# Altium schematic sheet Top_Sheet.SchDoc
size A; DocumentNumber: 1; SheetNumber: 1; SheetTotal: 13
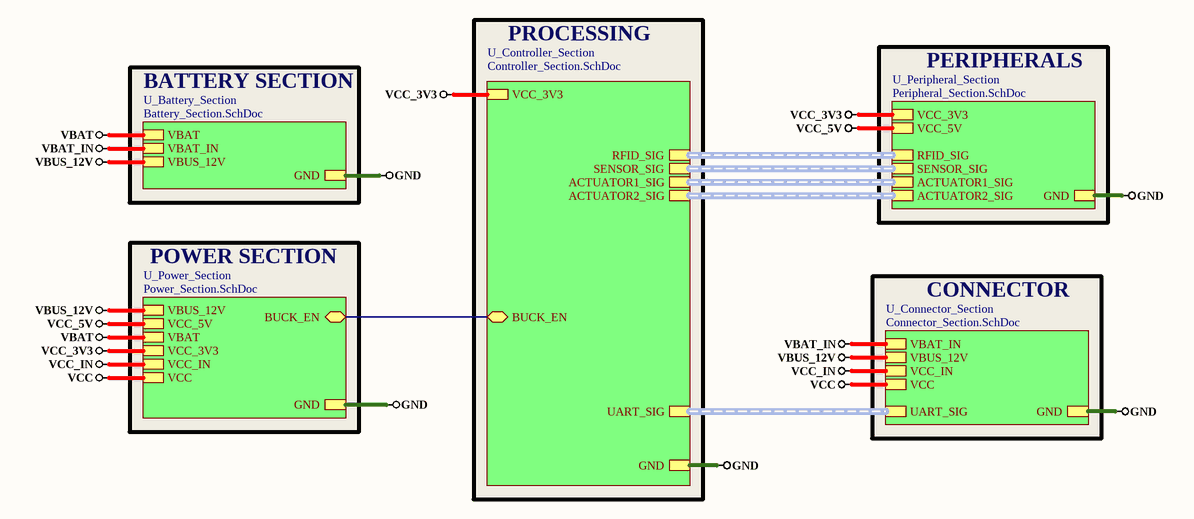
[diagram p0: Top_Sheet.SchDoc]

## Sub-sheets
U_Battery_Section = Battery_Section.SchDoc: VBAT, VBAT_IN, GND, VBUS_12V
U_Connector_Section = Connector_Section.SchDoc: GND, UART_SIG (harness UART_SIG), VBAT_IN, VBUS_12V, VCC_IN, VCC
U_Controller_Section = Controller_Section.SchDoc: ACTUATOR1_SIG (harness ACTUATOR1_SIG), ACTUATOR2_SIG (harness ACTUATOR2_SIG), GND, VCC_3V3, UART_SIG (harness UART_SIG), SENSOR_SIG (harness SENSOR_SIG), RFID_SIG (harness RFID_SIG), BUCK_EN (bidir)
U_Peripheral_Section = Peripheral_Section.SchDoc: GND, RFID_SIG (harness RFID_SIG), SENSOR_SIG (harness SENSOR_SIG), ACTUATOR2_SIG (harness ACTUATOR2_SIG), VCC_3V3, VCC_5V, ACTUATOR1_SIG (harness ACTUATOR1_SIG)
U_Power_Section = Power_Section.SchDoc: GND, VBUS_12V, VCC_5V, VBAT, VCC_3V3, VCC_IN, VCC, BUCK_EN (bidir)

## Nets
GND: sheet U_Controller_Section/GND, sheet U_Connector_Section/GND, sheet U_Battery_Section/GND, sheet U_Peripheral_Section/GND, sheet U_Power_Section/GND
VBAT: sheet U_Battery_Section/VBAT, sheet U_Power_Section/VBAT
VBAT_IN: sheet U_Connector_Section/VBAT_IN, sheet U_Battery_Section/VBAT_IN
VBUS_12V: sheet U_Connector_Section/VBUS_12V, sheet U_Battery_Section/VBUS_12V, sheet U_Power_Section/VBUS_12V
VCC: sheet U_Connector_Section/VCC, sheet U_Power_Section/VCC
VCC_3V3: sheet U_Controller_Section/VCC_3V3, sheet U_Peripheral_Section/VCC_3V3, sheet U_Power_Section/VCC_3V3
VCC_5V: sheet U_Peripheral_Section/VCC_5V, sheet U_Power_Section/VCC_5V
VCC_IN: sheet U_Connector_Section/VCC_IN, sheet U_Power_Section/VCC_IN
(unnamed): sheet U_Controller_Section/BUCK_EN, sheet U_Power_Section/BUCK_EN

## Buses and harness runs
harness sheet U_Connector_Section/UART_SIG = sheet U_Controller_Section/UART_SIG
harness sheet U_Controller_Section/ACTUATOR1_SIG = sheet U_Peripheral_Section/ACTUATOR1_SIG
harness sheet U_Controller_Section/ACTUATOR2_SIG = sheet U_Peripheral_Section/ACTUATOR2_SIG
harness sheet U_Controller_Section/RFID_SIG = sheet U_Peripheral_Section/RFID_SIG
harness sheet U_Controller_Section/SENSOR_SIG = sheet U_Peripheral_Section/SENSOR_SIG

## Notes on the sheet
- BATTERY SECTION
- PROCESSING
- PERIPHERALS
- POWER SECTION
- CONNECTOR